# Altium schematic sheet Sheet3.SchDoc
size A; SheetNumber: 3; SheetTotal: 3
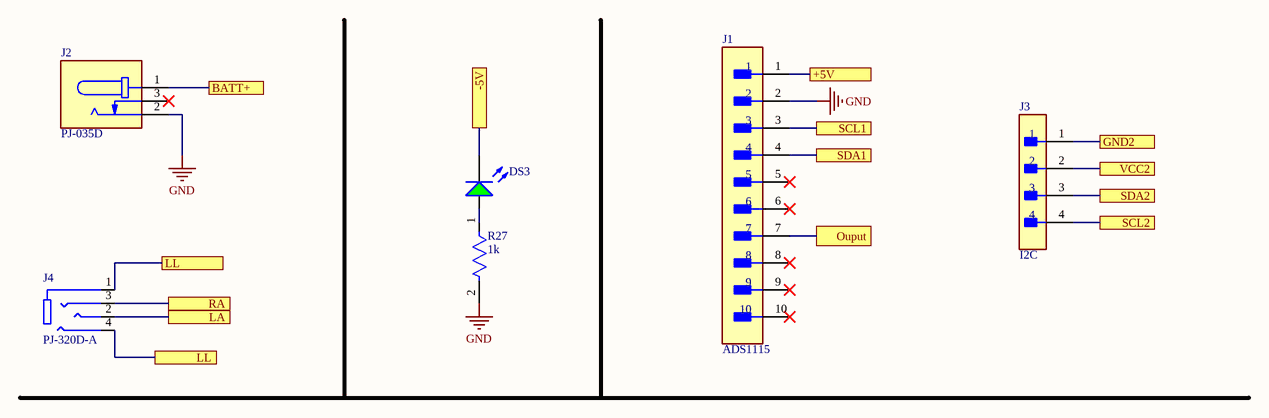
[diagram p0: Sheet3.SchDoc]

## Parts
DS3  (no value)  [LTST-C230KGKT_V]
J1  ADS1115  [FP-TS-110-T-A-MFG]
J2  PJ-035D  [CUI_PJ-035D]
J3  I2C  [FP-TSW-104-23-T-S-MFG]
J4  PJ-320D-A  [HRO_PJ-320D-A]
R27  1k  [FP-ESR03-IPC_A]

## Ports
+5V, -5V, BATT+, GND2, LA, LL, Ouput, RA, SCL1, SCL2, SDA1, SDA2, VCC2

## Nets
GND: J1.2 J2.2 R27.2
+5V: J1.1 ; port +5V
-5V: DS3.2(K) ; port -5V
BATT+: J2.1 ; port BATT+
GND2: J3.1 ; port GND2
LA: J4.2(TIP) ; port LA
LL: J4.1(SLEEVE) J4.4(RING2) ; port LL
Ouput: J1.7 ; port Ouput
RA: J4.3(RING1) ; port RA
SCL1: J1.3 ; port SCL1
SCL2: J3.4 ; port SCL2
SDA1: J1.4 ; port SDA1
SDA2: J3.3 ; port SDA2
VCC2: J3.2 ; port VCC2
NetDS3_1: DS3.1(A) R27.1

Not connected (* = marked no-connect by the designer): J1 5* 6* 8* 9* 10*; J2 3*

## Library data of the parts
DS3 = CMP-2000-06625-1: LED Green, 75 mW, 30 mA, -30 to 85 degC, 2-Pin SMD, RoHS, Tape and Reel; Manufacturer: Lite-On; Product Length (mm): 3.2mm; Type: Uni-Color; Peak Wavelength: 574nm; Shape Type: Rectangular; DELETED: Compliant; Lum Intensity: 35mcd; Forward Voltage: 2.4V; High Brightness: Yes; Rad Hardened: No; Power Dissipation: 75W; Forward Current: 30mA; Emitting Color: YellowGreen; Main Category: ChipLED; Product Height (mm): 1.1mm; Product Depth (mm): 1.6mm; Number of  Elements: 1; Viewing Angle: 130deg; Chip Material: AlGaInP; Dominant Wave Length: 571nm; Test Current (It): 20mA; Reverse Voltage: 5V; Mounting: SurfaceMount; Datasheet URL: http://optoelectronics.liteon.com/upload/download/DS22-2000-256/S_110_LTST-C230KGKT.pdf; Luminous Intensity: 35mcd; Pin Count: 2; Mounting Technology: SurfaceMount; Operating Temperature Classification: Industrial; Operating Temp Range: -55Cto85C; Package Type: ChipLed; Manufacturer URL: http://www.us.liteon.com/; Package Description: 2-Pin Surface Mount Device, Body 3.2 x 1.6 mm; Package Reference: C230KGKT; Datasheet Version: Rev. G, 12/2014; Lens Dimensions: 1.5X1.6X0.82mm; Packaging: TapeandReel
J1 = CMP-02766-000078-1: CONN HEADER VERT 10POS 2.54MM; Manufacturer Part Number: TS-110-T-A; Manufacturer: SAMTEC; Conn Orientation: Straight; Number Of Contacts: 10; Conn Gender: Male; Automotive: No; Digikey Description: CONN HEADER VERT 10POS 2.54MM; Temperature Range Low: -55°C; Number Of Rows: 1; Contact Material: Tin,Copper; Device Class L2: Headers and Wire Housings; Device Class L3: unset; ComponentLink2Description: Datasheet; RoHS: TRUE; Octopart: https://octopart.com/ts-110-t-a-samtec-275237; Category: Conn; Package: 0; Height: 8.16mm; Lead Free: Yes; Device Class L1: Connectors; Temperature Range High: +105°C; Temperature: -55°C to +105°C; Pitch: 2.54mm; ComponentLink2URL: http://suddendocs.samtec.com/prints/tx-1xx-x-x-mkt1.pdf; Footprint Url: http://suddendocs.samtec.com/prints/tx-1xx-x-x-footprint.pdf
J2 = PJ-035D: Power Barrel Connector Jack 1.30mm ID (0.051), 3.50mm OD (0.138) Through Hole, Right Angle; MF: Same Sky; MP: PJ035D; SnapEDA_Link: https://www.snapeda.com/parts/PJ035D/Same+Sky/view-part/?ref=snap; Package: None; Value: *; Check_prices: https://www.snapeda.com/parts/PJ035D/Same+Sky/view-part/?ref=eda
J3 = CMP-02766-001388-1: CONN HEADER VERT 4POS 2.54MM; Number of Contacts: 4; Gender: Male; Connector Type: Male Pin; Max Voltage Rating (AC): 550V; Max Current Rating: 7.6A; Radiation Hardening: No; Lead Free: Lead Free; RoHS Compliant: Yes; Contact Material: Bronze; Number of Positions: 4; Housing Color: Black; Min Operating Temperature: -55°C; Mount: Through Hole; Number of Rows: 1; Orientation: Straight; Contact Mating Length: 0.23inch; Contact Type: Male Pin; REACH SVHC: No SVHC; Max Operating Temperature: 105°C; Color: Black; Pitch: 2.54mm; Length: 10.16mm; Series: TSW; Packaging: Bulk; Contact Plating: Tin; Package Quantity: 1; Termination: Solder; Housing Material: Polyester; Width: 2.54mm; Depth: 2.54mm
J4 = PJ-320D-A: Headphone jack 0.5A 30V DC 100 mÎ©; MF: HRO Electronics Co., Ltd.; Package: Package; MP: PJ-320D-A; Check_prices: https://www.snapeda.com/parts/PJ-320D-A/HRO+Electronics+Co.%252C+Ltd./view-part/?ref=eda; Value: *; Availability: Not in stock; Price: None; SnapEDA_Link: https://www.snapeda.com/parts/PJ-320D-A/HRO+Electronics+Co.%252C+Ltd./view-part/?ref=snap
R27 = CMP-08839-029483-1: 1kΩ ±1% 0.25W 0603 Anti-Surge Chip Resistor AEC-Q200; Power Rating: 250mW; Resistance: 1kR; Temperature Coefficient: 100ppm/°C; Series: ESR; Max Operating Temperature: 155°C; Case Code (Metric): 1608; Package Quantity: 1; Case/Package: 0603; Size Code: 0603; Case Code (Imperial): 0603; Min Operating Temperature: -55°C; Tolerance: 1%; Max Power Dissipation: 250mW; Number of Terminations: 2; RoHS Compliant: Yes; Lead Free: Lead Free; Packaging: Tape and Reel; Height: 0.022inch; Width: 0.031inch; Features: Automotive AEC-Q200; Resistor Type: Thick Film; Length: 0.063inch